# EasyEDA Pro project 手势小车.epro

# Schematic Schematic1
Assembly Variant: Basic; Board Name: Board1; Create Date: 2026-04-14; Page Name: P1; Project Name: TB-112-基于双模无线通信的智能小车运动控制系统设计; Schematic Name: Schematic1; Update Date: 2026-04-14; Company: 嘉立创EDA; Page Size: A4; Version: V1.0
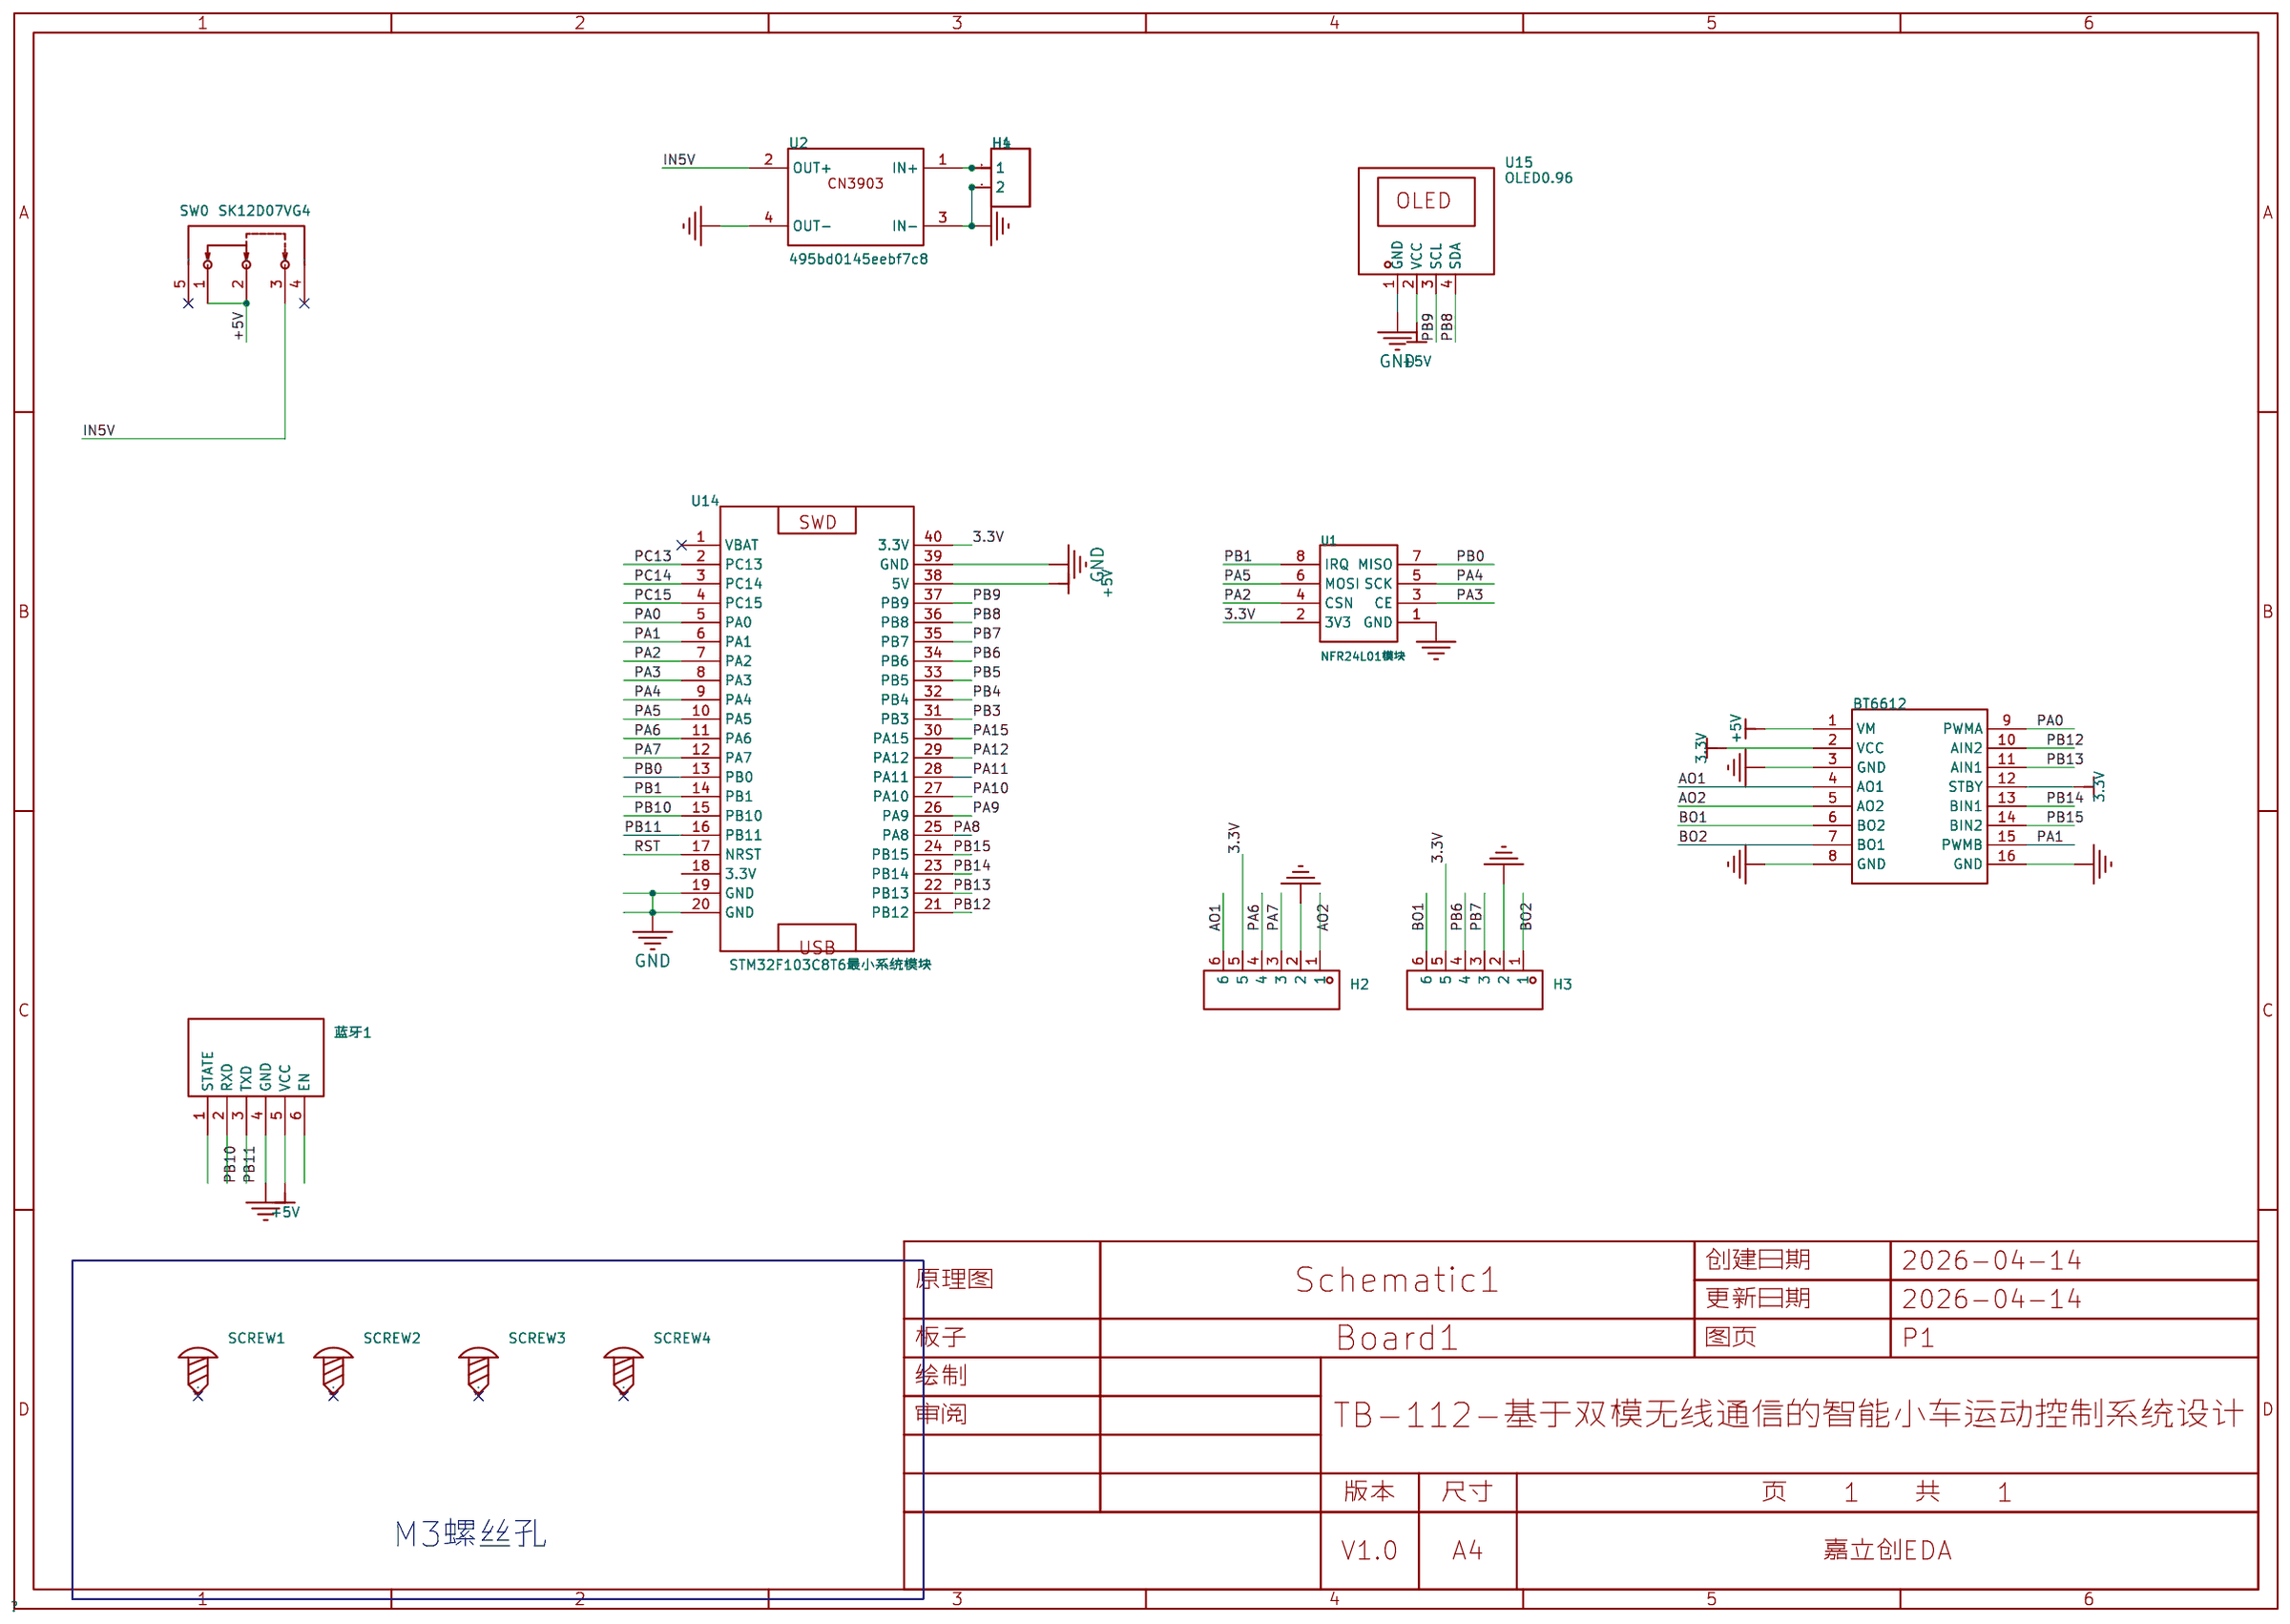
[diagram p0: schematic sheet]

## Parts
BT6612  -  [TB6612模块]
H1  -  [HDR-TH_2P-P2.54-V-F]
H2  -  [HDR-TH_6P-P2.54-V-F]
H3  -  [HDR-TH_6P-P2.54-V-F]
H4  -  [HDR-TH_2P-P2.54-V-F]
SCREW1  -  [M3螺丝]
SCREW2  -  [M3螺丝]
SCREW3  -  [M3螺丝]
SCREW4  -  [M3螺丝]
SW0  SK12D07VG4  [SW-TH_SK12D07VG4]
U1  NFR24L01模块  [NRF24L01模块]
U2  495bd0145eebf7c8  [PWRM_SMD_AJ38_L18_W13]
U14  STM32F103C8T6最小系统模块  [STM32F103C8T6核心板]
U15  OLED0.96  [OLED0.96-4PIN]
蓝牙1  -  [蓝牙模块]

## Library data of the parts
BT6612 = tb6612模块
H1 H4 = HDR-F_2.54_1x2P: Supplier Part: C49661; Supplier Footprint: 插件
H2 H3 = HDR-F_2.54_1x6P: Supplier Part: C40877; Supplier Footprint: 插件
SCREW1-SCREW4 = M3螺丝: Supplier Footprint: 插件
SW0 = SK12D07VG4: 电路结构:单刀双掷;安装方式:-;额定电流(DC):500mA;额定电压(DC):50V;额定电流(AC):-;额定电压(AC):-;机械寿命:5千次;; LCSC Part Name: 3脚2档位 卧插 滑动开关; Supplier Part: C393937; Manufacturer: SHOU HAN(首韩); Supplier Footprint: 插件; JLCPCB Part Class: 扩展库; Datasheet: https://atta.szlcsc.com/upload/public/pdf/source/20190521/C393937_939FE26E571CC67D2D532E953108A1B0.pdf; Supplier: LCSC; Circuit: 单刀双掷; Actuator Style: 矩形柱状; Pin Style: PC引脚; Switch Height: 8.8mm; Current Rating (DC): 500mA; Voltage Rating (DC): 50V; Mechanical Life: 5千次; ID: $1I1933
U1 = NFR24L01模块
U2 = PWRM_AJ38_Buck_3A: 4.5V-30V输入，3A，迷你降压模块
U14 = STM32F103C8T6核心板: tags: STM32; Supplier Part: C8734; Manufacturer: 无; image: http://image.lceda.cn/szlcsc/C8734.jpg; _: 3; JLCPCB Part Class: 扩展库
U15 = OLED0.96
蓝牙1 = 蓝牙模块: HC-05; Manufacturer: 无; Manufacturer Part: 无; Supplier Part: 无; Supplier: Taobao; link: 无

## Nets
3.3V: BT6612.2(VCC) BT6612.12(STBY) H2.5 H3.5 U1.2(3V3) U14.40(3.3V)
+5V: BT6612.1(VM) SW0.1 SW0.2 U14.38(5V) U15.2(VCC) 蓝牙1.5(VCC)
+12V: H1.1 H4.1 U2.1(IN+)
GND: BT6612.3(GND) BT6612.8(GND) BT6612.16(GND) H1.2 H2.2 H3.2 H4.2 U1.1(GND) U2.3(IN-) U2.4(OUT-) U14.19(GND) U14.20(GND) U14.39(GND) U15.1(GND) 蓝牙1.4(GND)
AO1: BT6612.4(AO1) H2.6
AO2: BT6612.5(AO2) H2.1
BO1: BT6612.6(BO2) H3.6
BO2: BT6612.7(BO1) H3.1
IN5V: SW0.3 U2.2(OUT+)
PA0: BT6612.9(PWMA) U14.5(PA0)
PA1: BT6612.15(PWMB) U14.6(PA1)
PA2: U1.4(CSN) U14.7(PA2)
PA3: U1.3(CE) U14.8(PA3)
PA4: U1.5(SCK) U14.9(PA4)
PA5: U1.6(MOSI) U14.10(PA5)
PA6: H2.4 U14.11(PA6)
PA7: H2.3 U14.12(PA7)
PA8: U14.25(PA8)
PA9: U14.26(PA9)
PA10: U14.27(PA10)
PA11: U14.28(PA11)
PA12: U14.29(PA12)
PA15: U14.30(PA15)
PB0: U1.7(MISO) U14.13(PB0)
PB1: U1.8(IRQ) U14.14(PB1)
PB3: U14.31(PB3)
PB4: U14.32(PB4)
PB5: U14.33(PB5)
PB6: H3.4 U14.34(PB6)
PB7: H3.3 U14.35(PB7)
PB8: U14.36(PB8) U15.4(SDA)
PB9: U14.37(PB9) U15.3(SCL)
PB10: U14.15(PB10) 蓝牙1.2(RXD)
PB11: U14.16(PB11) 蓝牙1.3(TXD)
PB12: BT6612.10(AIN2) U14.21(PB12)
PB13: BT6612.11(AIN1) U14.22(PB13)
PB14: BT6612.13(BIN1) U14.23(PB14)
PB15: BT6612.14(BIN2) U14.24(PB15)
PC13: U14.2(PC13)
PC14: U14.3(PC14)
PC15: U14.4(PC15)
RST: U14.17(NRST)

Not connected (* = marked no-connect by the designer): SCREW1 1*; SCREW2 1*; SCREW3 1*; SCREW4 1*; SW0 4* 5*; U14 1(VBAT)* 18(3.3V); 蓝牙1 1(STATE) 6(EN)

## Notes on the sheet
- M3螺丝孔

# Schematic Schematic2
Assembly Variant: Basic; Board Name: Board2; Create Date: 2026-04-14; Page Name: P1; Project Name: TB-112-基于双模无线通信的智能小车运动控制系统设计; Schematic Name: Schematic2; Update Date: 2026-04-14; Company: 嘉立创EDA; Page Size: A4; Version: V1.0
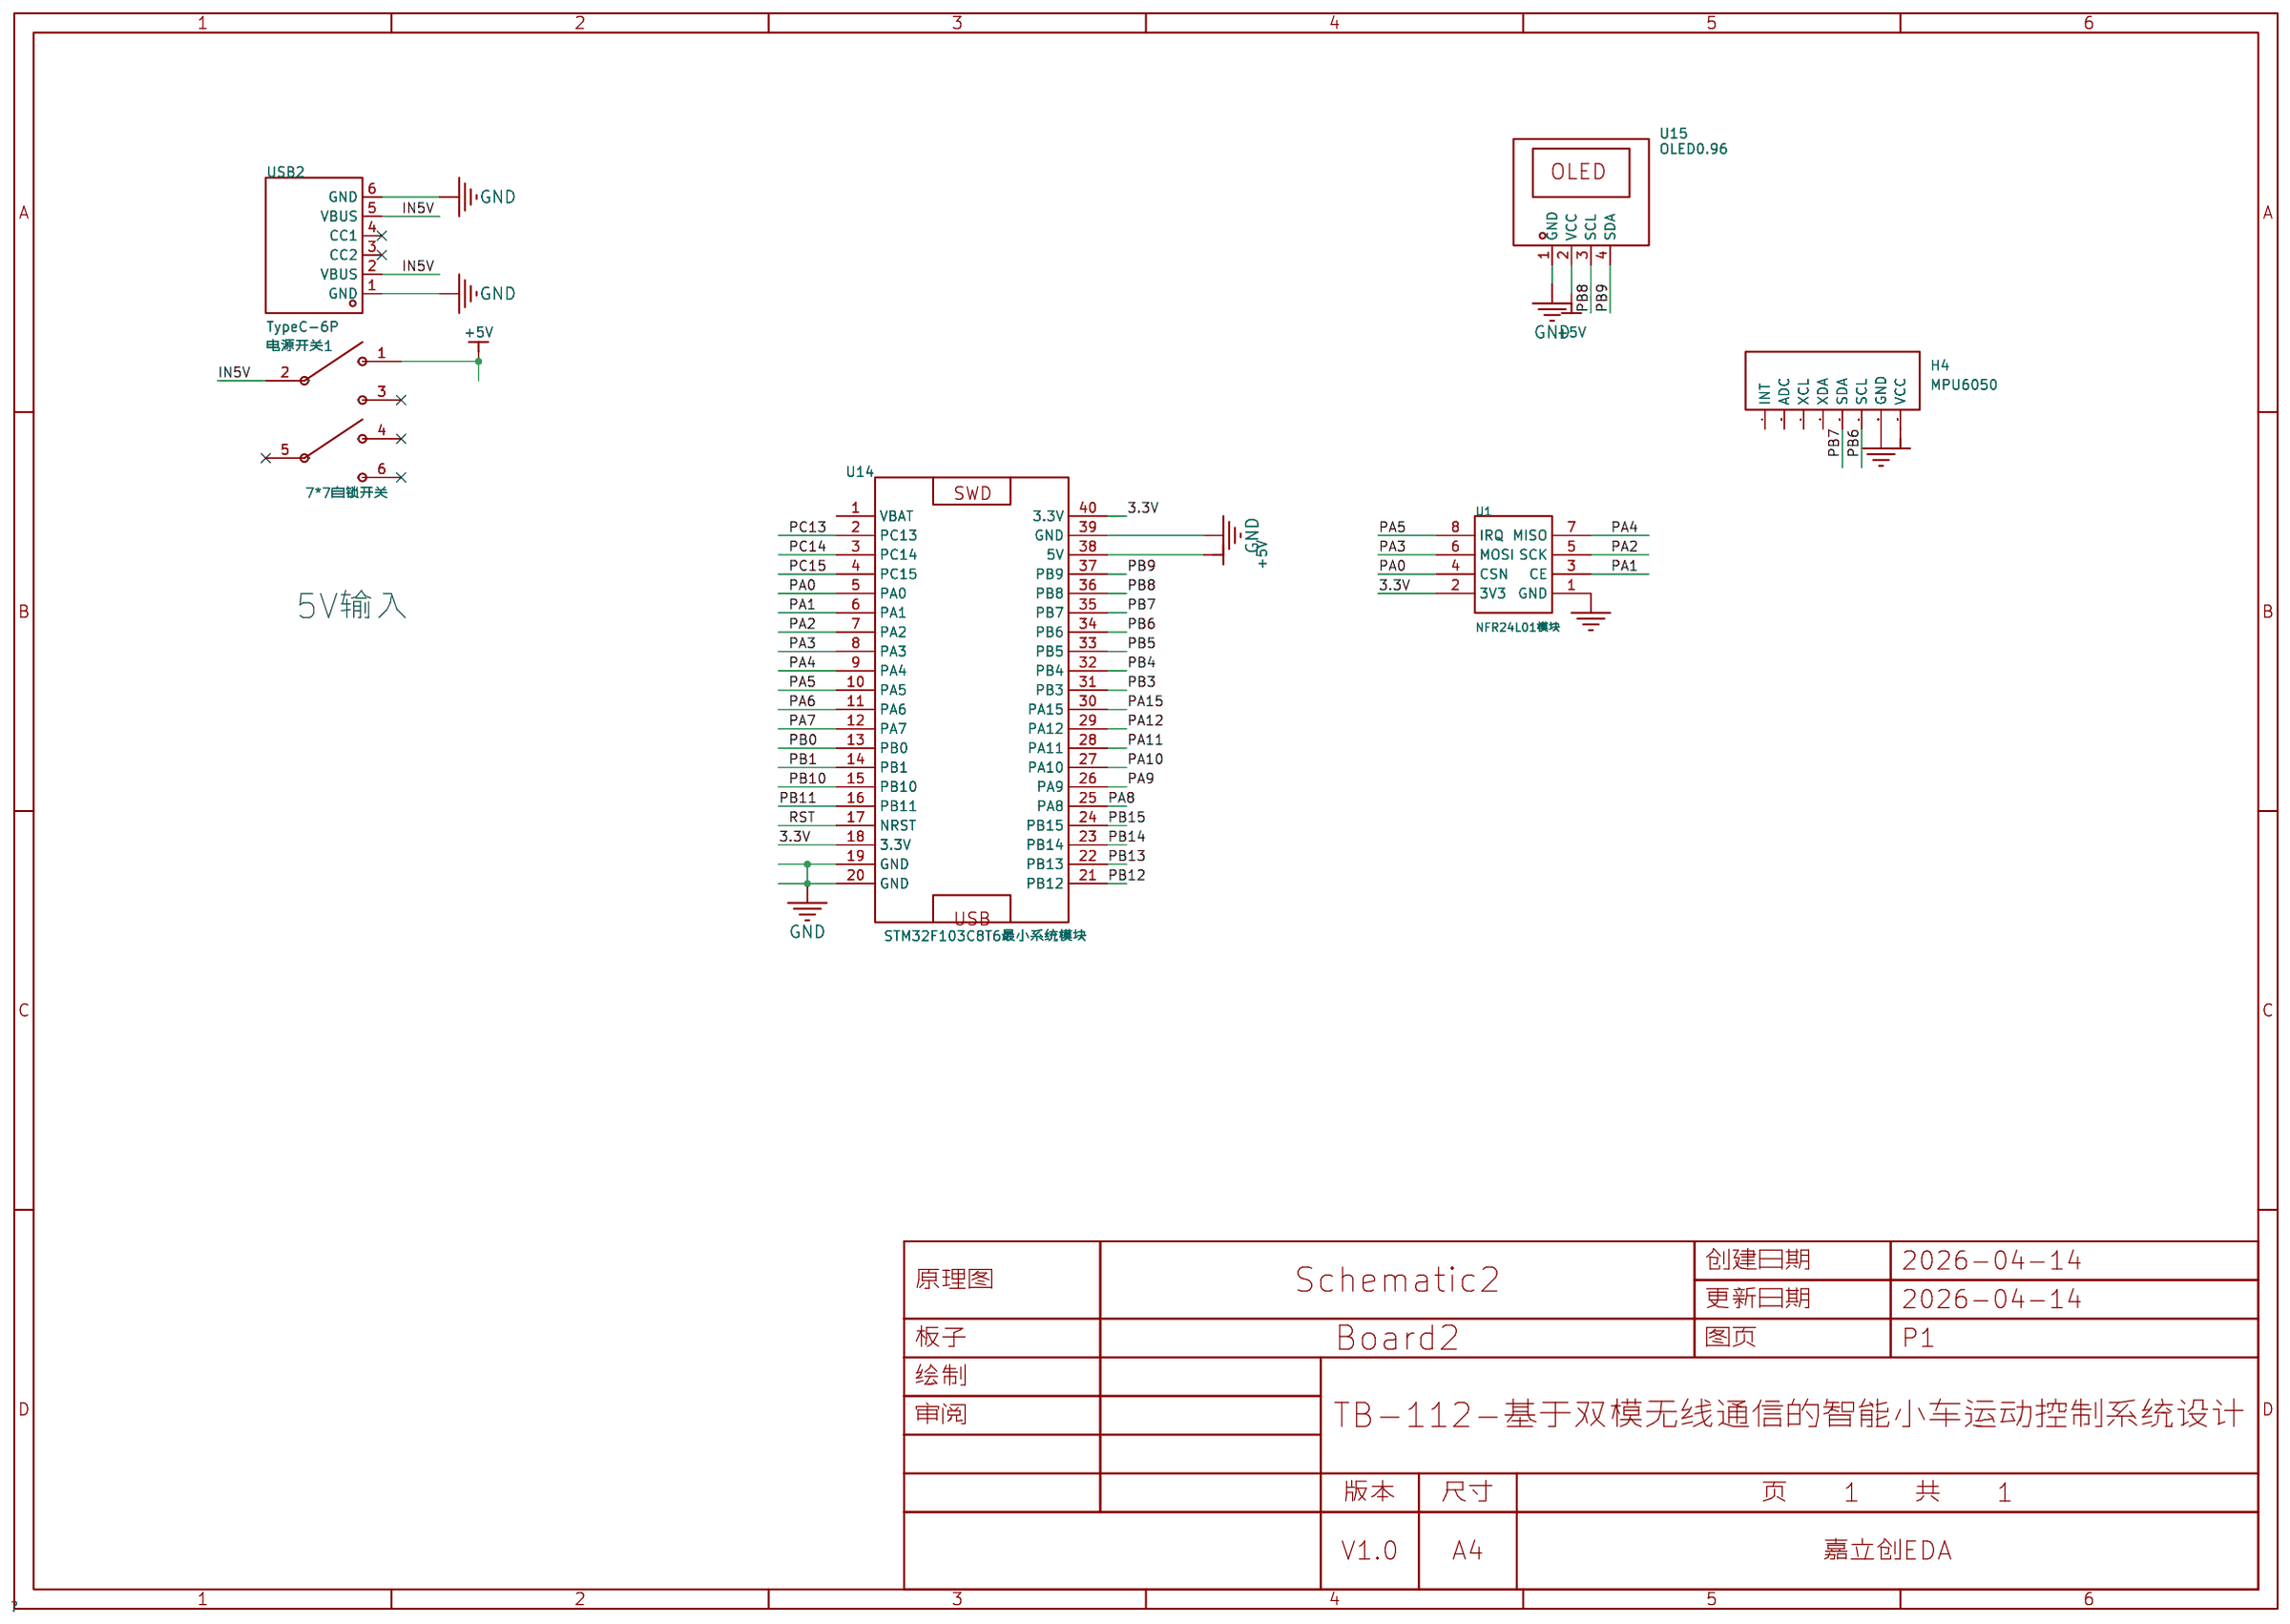
[diagram p1: schematic sheet]

## Parts
H4  MPU6050  [MPU6050模块]
U1  NFR24L01模块  [NRF24L01模块]
U14  STM32F103C8T6最小系统模块  [STM32F103C8T6核心板]
U15  OLED0.96  [OLED0.96-4PIN]
USB2  TypeC-6P  [TYPEC-6P]
电源开关1  7*7自锁开关  [7*7自锁开关]

## Library data of the parts
H4 = MPU6050模块: _: 3
U1 = NFR24L01模块
U14 = STM32F103C8T6核心板: tags: STM32; Supplier Part: C8734; Manufacturer: 无; image: http://image.lceda.cn/szlcsc/C8734.jpg; _: 3; JLCPCB Part Class: 扩展库
U15 = OLED0.96
USB2 = TYPEC-6P COPY: Supplier: 淘宝; Supplier Part: C720624; Manufacturer: XUNPU(讯普); JLCPCB Part Class: 扩展库; link: 8.0 hi:/哈JXGsXK5mtSC信  贴片USB-3.1插座 Type-C母座 6P简易型 4固定插脚 大电流快冲专用
电源开关1 = 7*7自锁开关: Supplier Part: 6; Supplier: 淘宝; link: https://item.taobao.com/item.htm?spm=a1z09.2.0.0.5y5hcl&id=22614135538&_u=21p4iun08d4e; _: 3

## Nets
3.3V: U1.2(3V3) U14.18(3.3V) U14.40(3.3V)
+5V: H4.VCC U14.38(5V) U15.2(VCC) 电源开关1.1(3)
GND: H4.GND U1.1(GND) U14.19(GND) U14.20(GND) U14.39(GND) U15.1(GND) USB2.1(GND) USB2.6(GND)
IN5V: USB2.2(VBUS) USB2.5(VBUS) 电源开关1.2(1)
PA0: U1.4(CSN) U14.5(PA0)
PA1: U1.3(CE) U14.6(PA1)
PA2: U1.5(SCK) U14.7(PA2)
PA3: U1.6(MOSI) U14.8(PA3)
PA4: U1.7(MISO) U14.9(PA4)
PA5: U1.8(IRQ) U14.10(PA5)
PA6: U14.11(PA6)
PA7: U14.12(PA7)
PA8: U14.25(PA8)
PA9: U14.26(PA9)
PA10: U14.27(PA10)
PA11: U14.28(PA11)
PA12: U14.29(PA12)
PA15: U14.30(PA15)
PB0: U14.13(PB0)
PB1: U14.14(PB1)
PB3: U14.31(PB3)
PB4: U14.32(PB4)
PB5: U14.33(PB5)
PB6: H4.SCL U14.34(PB6)
PB7: H4.SDA U14.35(PB7)
PB8: U14.36(PB8) U15.3(SCL)
PB9: U14.37(PB9) U15.4(SDA)
PB10: U14.15(PB10)
PB11: U14.16(PB11)
PB12: U14.21(PB12)
PB13: U14.22(PB13)
PB14: U14.23(PB14)
PB15: U14.24(PB15)
PC13: U14.2(PC13)
PC14: U14.3(PC14)
PC15: U14.4(PC15)
RST: U14.17(NRST)

Not connected (* = marked no-connect by the designer): H4 ADC INT XCL XDA; U14 1(VBAT); USB2 3(CC2)* 4(CC1)*; 电源开关1 3(4)* 4(5)* 5(2)* 6*

## Notes on the sheet
- 5V输入

# Board PCB1
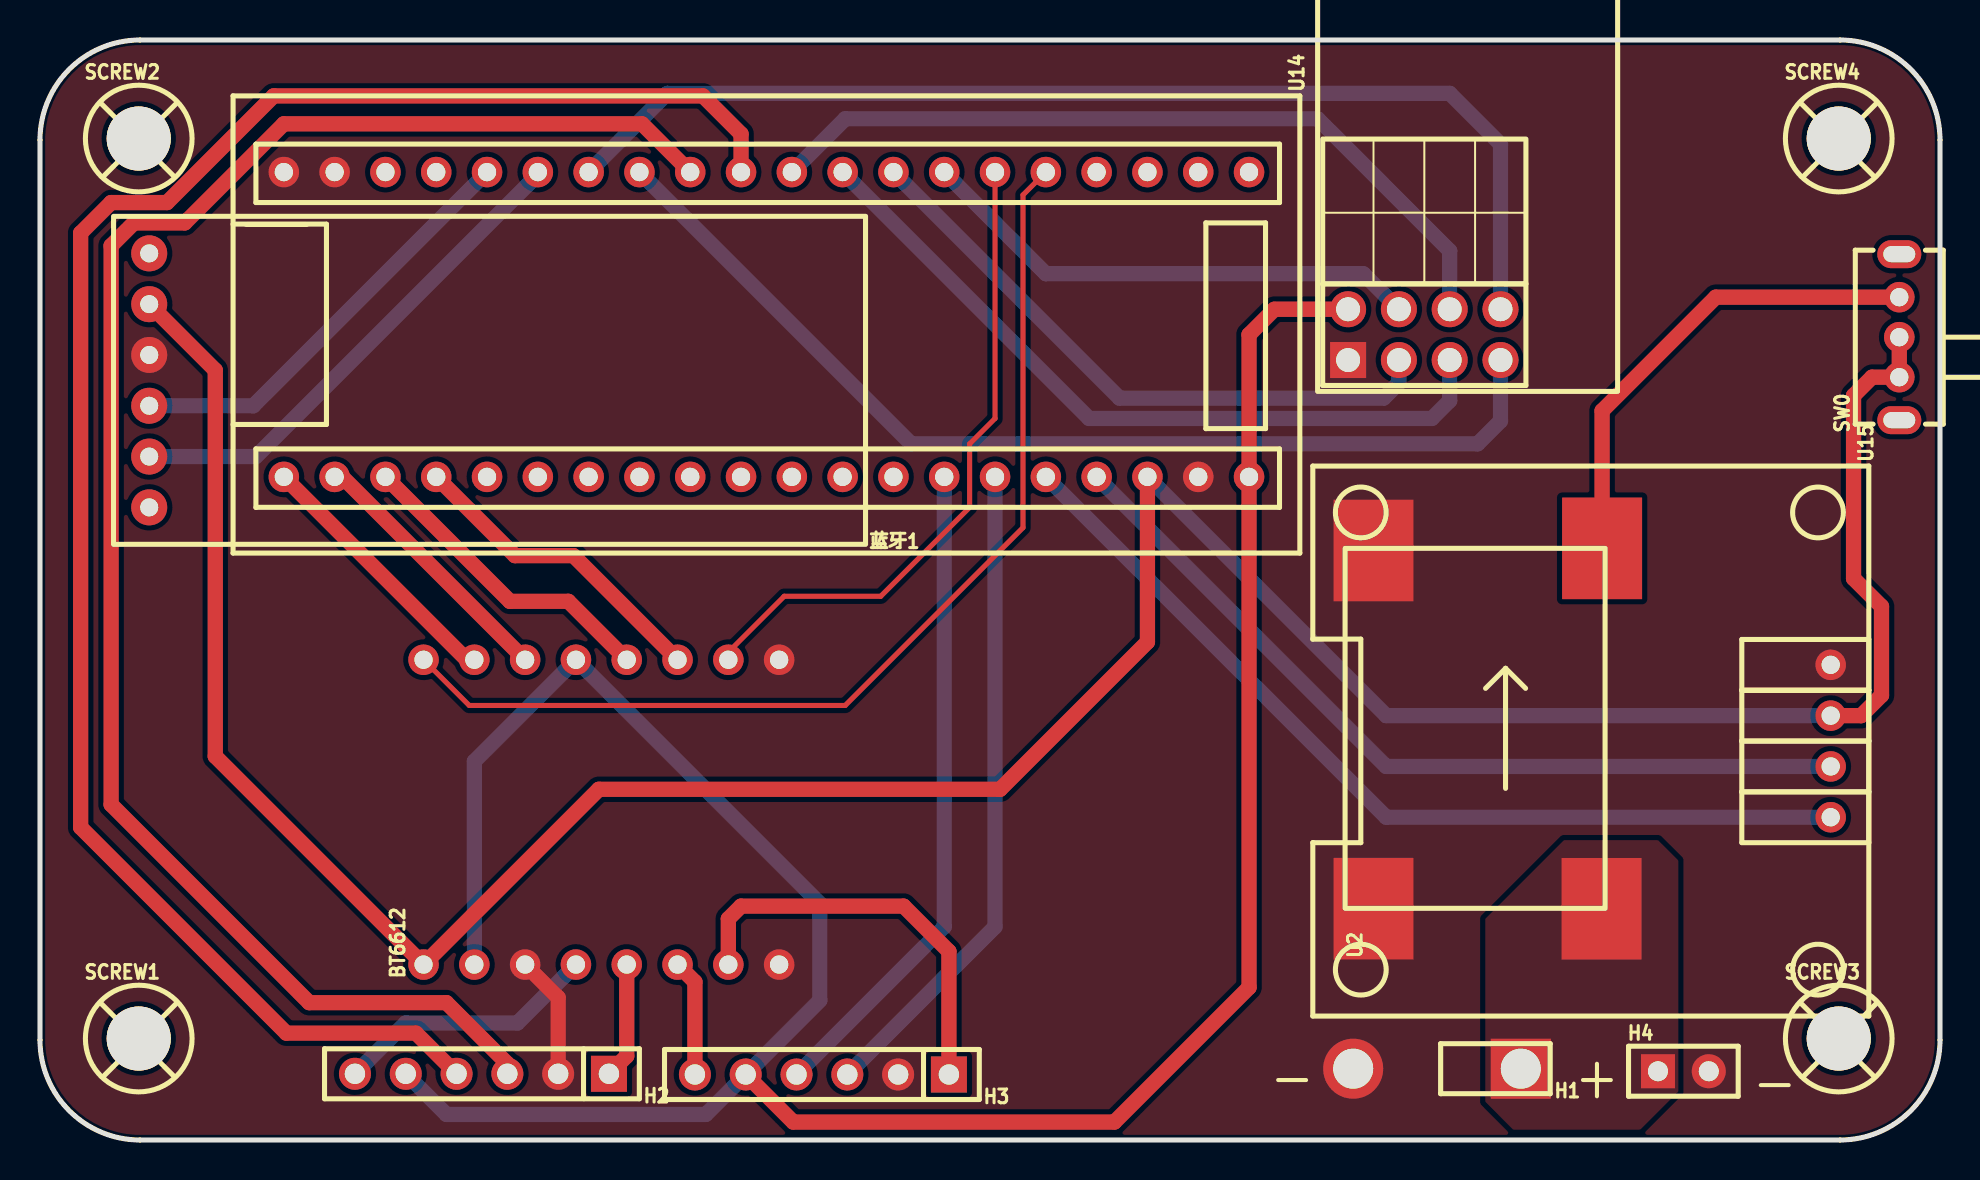
[diagram p2: board, top side]
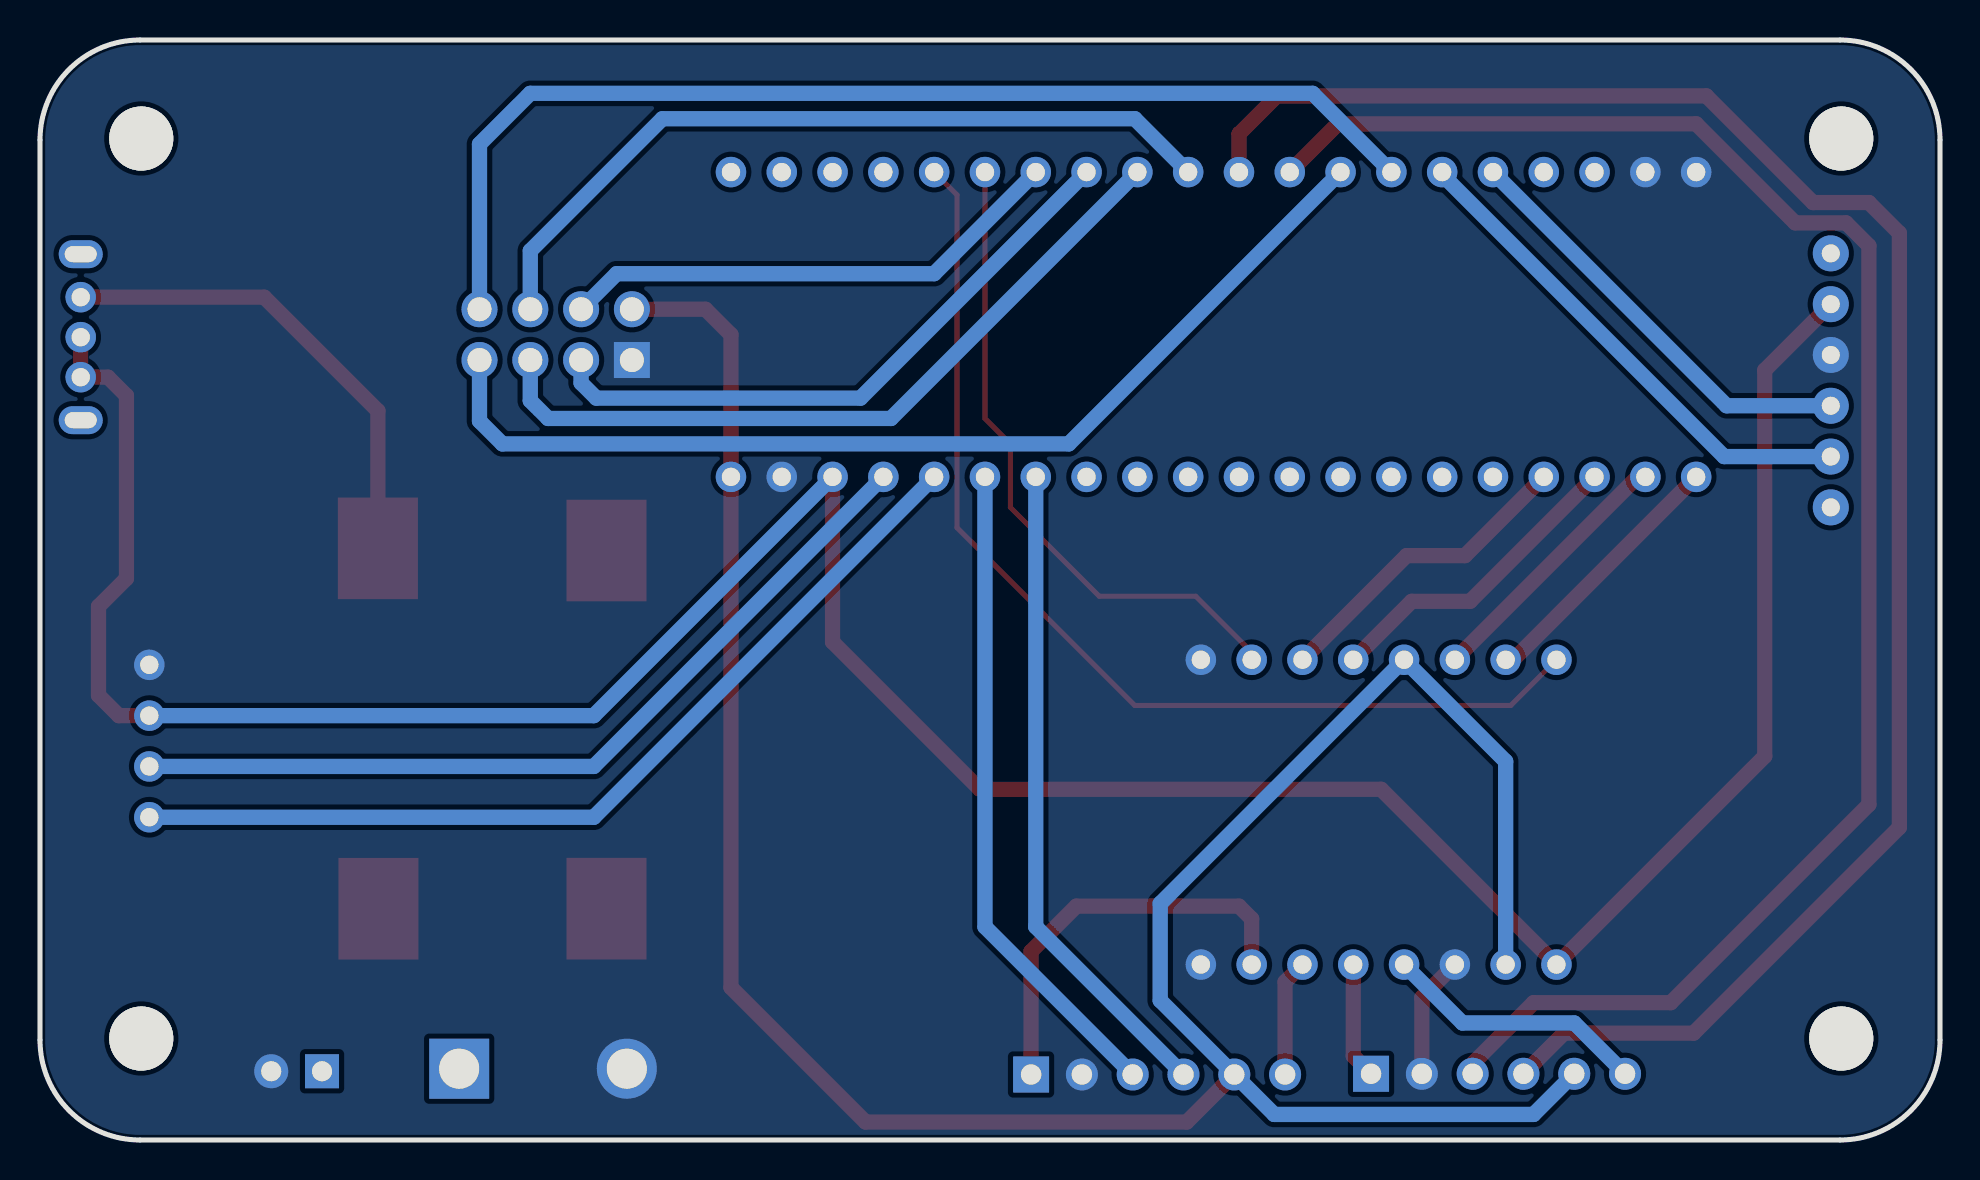
[diagram p3: board, bottom side, seen from below]

Outline 95 x 55 mm; copper layers: Top Layer, Bottom Layer. Coordinates in mm from the lower left corner of the outline.
Outline path: 0,50 0,5 arc(1.46,1.46) 5,0 90,0 arc(93.54,1.46) 95,5 95,50 arc(93.54,53.54) 90,55 5,55 arc(1.46,53.54) 0,50
Stack: Top Layer 0.035mm / Dielectric1 1.51mm FR4 er 4.5 / Bottom Layer 0.035mm

## Design rules (mm)
spacing copperThickness1oz (default): track to track 0.102, other pairs 0.152 to 0.3
spacing copperThickness2oz: track to track 0.203, other pairs 0.152 to 0.3
track width copperThickness1oz (default): min 0.127, default 0.762, max 2.54
track width copperThickness2oz: min 0.203, default 0.254, max 2.54
differential pair differentialPair (default): width min 0.127, default 0.254, max 2.54; gap min 0.152, default 0.152
net GND uses copperRegion
net +12V uses copperRegion

## Placement (name value [footprint] x y rotation side)
BT6612  -  [TB6612模块]  24.13 11.57 90 top
H1  -  [HDR-TH_2P-P2.54-V-F]  72.77 3.57 180 top
H2  -  [HDR-TH_6P-P2.54-V-F]  22.1 3.31 180 top
H3  -  [HDR-TH_6P-P2.54-V-F]  39.1 3.28 180 top
H4  -  [HDR-TH_2P-P2.54-V-F#2]  82.17 3.44 0 top
SCREW1  -  [M3螺丝]  5 5.01 0 top
SCREW2  -  [M3螺丝]  5 50.01 0 top
SCREW3  -  [M3螺丝]  90 5.01 0 top
SCREW4  -  [M3螺丝]  90 50.01 0 top
SW0  SK12D07VG4  [SW-TH_SK12D07VG4]  92.96 40.14 90 top
U1  NFR24L01模块  [NRF24L01模块]  69.22 40.27 0 top
U2  495bd0145eebf7c8  [PWRM_SMD_AJ38_L18_W13]  73.28 20.58 90 top
U14  STM32F103C8T6最小系统模块  [STM32F103C8T6核心板]  36.32 40.78 270 top
U15  OLED0.96  [OLED0.96-4PIN]  90.17 19.95 270 top
蓝牙1  -  [蓝牙模块]  23.5 38.36 180 top

## Footprints (pads in the part's own frame, mm; a bottom-side part is the same pattern mirrored in y, then rotated)
HDR-TH_2P-P2.54-V-F
  rect 3x3 hole 2: 1(-1.27,0)
  round 3 hole 2: 2(7.112,0)
HDR-TH_2P-P2.54-V-F#2
  rect 1.7x1.7 hole 1: 1(-1.27,0)
  round 1.7 hole 1: 2(1.27,0)
HDR-TH_6P-P2.54-V-F
  rect 1.8x1.8 hole 1.02: 1(-6.35,0)
  round 1.6 hole 1.02: 2(-3.81,0) 3(-1.27,0) 4(1.27,0) 5(3.81,0) 6(6.35,0)
M3螺丝
  round 3.2 hole 3.2: 1(-0.064,0.064)
NRF24L01模块
  rect 1.8x1.8 hole 1.2: 1(-3.81,-1.27)
  round 1.8 hole 1.2: 2(-3.81,1.27) 3(-1.27,-1.27) 4(-1.27,1.27) 5(1.27,-1.27) 6(1.27,1.27) 7(3.81,-1.27) 8(3.81,1.27)
OLED0.96-4PIN
  round 1.524 hole 0.914: 1(-3.81,-0.635) 2(-1.27,-0.635) 3(1.27,-0.635) 4(3.81,-0.635)
PWRM_SMD_AJ38_L18_W13
  rect 5.08x4 smd: 1(-9.02,-4.801) 2(8.999,-4.826) 3(-9.017,6.604) 4(8.89,6.604)
STM32F103C8T6核心板
  round 1.524 hole 0.914: 1(-7.62,24.13) 2(-7.62,21.59) 3(-7.62,19.05) 4(-7.62,16.51) 5(-7.62,13.97) 6(-7.62,11.43) 7(-7.62,8.89) 8(-7.62,6.35) 9(-7.62,3.81) 10(-7.62,1.27) 11(-7.62,-1.27) 12(-7.62,-3.81) 13(-7.62,-6.35) 14(-7.62,-8.89) 15(-7.62,-11.43) 16(-7.62,-13.97) 17(-7.62,-16.51) 18(-7.62,-19.05) 19(-7.62,-21.59) 20(-7.62,-24.13) 21(7.62,-24.13) 22(7.62,-21.59) 23(7.62,-19.05) 24(7.62,-16.51) 25(7.62,-13.97) 26(7.62,-11.43) 27(7.62,-8.89) 28(7.62,-6.35) 29(7.62,-3.81) 30(7.62,-1.27) 31(7.62,1.27) 32(7.62,3.81) 33(7.62,6.35) 34(7.62,8.89) 35(7.62,11.43) 36(7.62,13.97) 37(7.62,16.51) 38(7.62,19.05) 39(7.62,21.59) 40(7.62,24.13)
SW-TH_SK12D07VG4
  round 1.524 hole 0.914: 1(-2,0) 2(0,0) 3(2,0)
  oval 1.4x2.2 hole 0.8x1.6: 4(4.15,0) 5(-4.15,0)
TB6612模块
  round 1.524 hole 0.914: 1(-2.794,4.953) 2(-2.794,2.413) 3(-2.794,-0.127) 4(-2.794,-2.667) 5(-2.794,-5.207) 6(-2.794,-7.747) 7(-2.794,-10.287) 8(-2.794,-12.827) 9(12.446,4.953) 10(12.446,2.413) 11(12.446,-0.127) 12(12.446,-2.667) 13(12.446,-5.207) 14(12.446,-7.747) 15(12.446,-10.287) 16(12.446,-12.827)
蓝牙模块
  round 1.8 hole 0.9: 1(18.034,6.731) 2(18.034,4.191) 3(18.034,1.651) 4(18.034,-0.889) 5(18.034,-3.429) 6(18.034,-5.969)

## Nets
As in the schematic.

Pads without a net: SCREW1 1; SCREW2 1; SCREW3 1; SCREW4 1; SW0 4 5; U14 1 18

## Routing (per net, layer and track width the routed paths; a pad name or vN(x,y) marks a point on that pad's centre or on a via; arc(x,y) is an arc through that point)
3.3V: length 130.4
  Top Layer w0.762: H3.5 37.66,0.9 53.72,0.9 60.45,7.63 U14.40 60.45,40.27 61.72,41.54 U1.2
  Bottom Layer w0.762: BT6612.2 21.72,18.93 BT6612.12 38.99,11.82 38.99,6.98 H3.5 33.29,1.28 20.32,1.28 H2.5
+5V: length 152.1
  Top Layer w0.762: U15.2 91.06,21.22 92.07,22.23 92.07,26.68 90.68,28.08 90.68,37.22 91.6,38.14 SW0.1 SW0.2 ; U14.38 55.37,24.9 48.01,17.54 27.94,17.54 BT6612.1 8.76,19.19 8.76,38.49 5.46,41.79
  Bottom Layer w0.762: U15.2 67.31,21.22 U14.38
GND: length 6.1
  Top Layer w0.762: BT6612.3 25.91,7.12 H2.2
AO1: length 13.3
  Bottom Layer w0.762: BT6612.4 23.88,5.85 18.29,5.85 H2.6
AO2: length 5.8
  Top Layer w0.762: H2.1 29.34,4.2 BT6612.5
BO1: length 5.9
  Top Layer w0.762: H3.6 32.75,7.9 BT6612.6
BO2: length 20.7
  Top Layer w0.762: H3.1 45.45,9.43 43.18,11.69 35.05,11.69 34.42,11.06 BT6612.7
IN5V: length 24.1
  Top Layer w0.762: SW0.3 83.79,42.14 78.1,36.46 U2.2
PA0: length 52.9
  Top Layer w0.254: U14.5 49.15,47.25 49.15,30.62 40.26,21.73 21.46,21.73 BT6612.9
PA1: length 32.7
  Top Layer w0.254: BT6612.15 34.42,24.39 37.21,27.19 42.04,27.19 46.48,31.63 46.48,34.81 47.75,36.08 U14.6
PA2: length 25.6
  Bottom Layer w0.762: U14.7 50.29,43.32 66.17,43.32 U1.4
PA3: length 31.4
  Bottom Layer w0.762: U1.3 67.94,37.86 67.18,37.09 53.97,37.09 U14.8
PA4: length 37.9
  Bottom Layer w0.762: U14.9 52.45,36.08 69.6,36.08 70.49,36.97 U1.5
PA5: length 39.7
  Bottom Layer w0.762: U1.6 70.49,44.46 63.88,51.06 40.26,51.06 U14.10
PA6: length 92.2
  Top Layer w0.762: H2.4 18.8,5.34 12.32,5.34 2.03,15.63 2.03,45.35 3.56,46.87 6.35,46.87 11.68,52.21 33.15,52.21 35.05,50.3 U14.11
PA7: length 86.1
  Top Layer w0.762: U14.12 30.1,50.81 12.19,50.81 7.24,45.86 4.7,45.86 3.56,44.71 3.56,16.77 13.46,6.87 20.32,6.87 23.37,3.82 H2.3
PB0: length 52.2
  Bottom Layer w0.762: U14.13 43.56,34.81 71.88,34.81 73.03,35.95 U1.7
PB1: length 56.5
  Bottom Layer w0.762: U1.8 73.03,49.79 70.49,52.33 31.37,52.33 U14.14
PB6: length 32.9
  Bottom Layer w0.762: H3.4 45.21,10.66 U14.34
PB7: length 32.9
  Bottom Layer w0.762: U14.35 47.75,10.66 H3.3
PB8: length 46.3
  Bottom Layer w0.762: U14.36 67.31,16.14 U15.4
PB9: length 42.7
  Bottom Layer w0.762: U15.3 67.31,18.68 U14.37
PB10: length 25.4
  Bottom Layer w0.762: 5.46,34.17 10.8,34.17 24.89,48.27 U14.15
PB11: length 21.7
  Bottom Layer w0.762: 5.46,36.71 10.67,36.71 U14.16
PB12: length 13.3
  Top Layer w0.762: U14.21 21.34,24.01 BT6612.10
PB13: length 13.3
  Top Layer w0.762: U14.22 15.11,33.16 BT6612.11
PB14: length 15.9
  Top Layer w0.762: U14.23 23.5,26.93 26.42,26.93 BT6612.13
PB15: length 15.9
  Top Layer w0.762: BT6612.14 26.67,29.22 23.75,29.22 U14.24

## Copper pours and planes (outline as drawn; the poured copper is in the pictures)
+12V on Top Layer: 76.2,15 80.9,15 81.91,13.98 81.91,2.42 80.01,0.52 73.66,0.52 72.26,1.91 72.26,11.06
GND on Top Layer: -6.98,60.08 102.87,60.08 102.87,-9.01 -6.98,-9.01
GND on Bottom Layer: -3.68,63.89 105.03,63.89 105.03,-7.99 -3.68,-7.99

## Text on the board
Top Silkscreen Layer: - | +

# Board PCB2
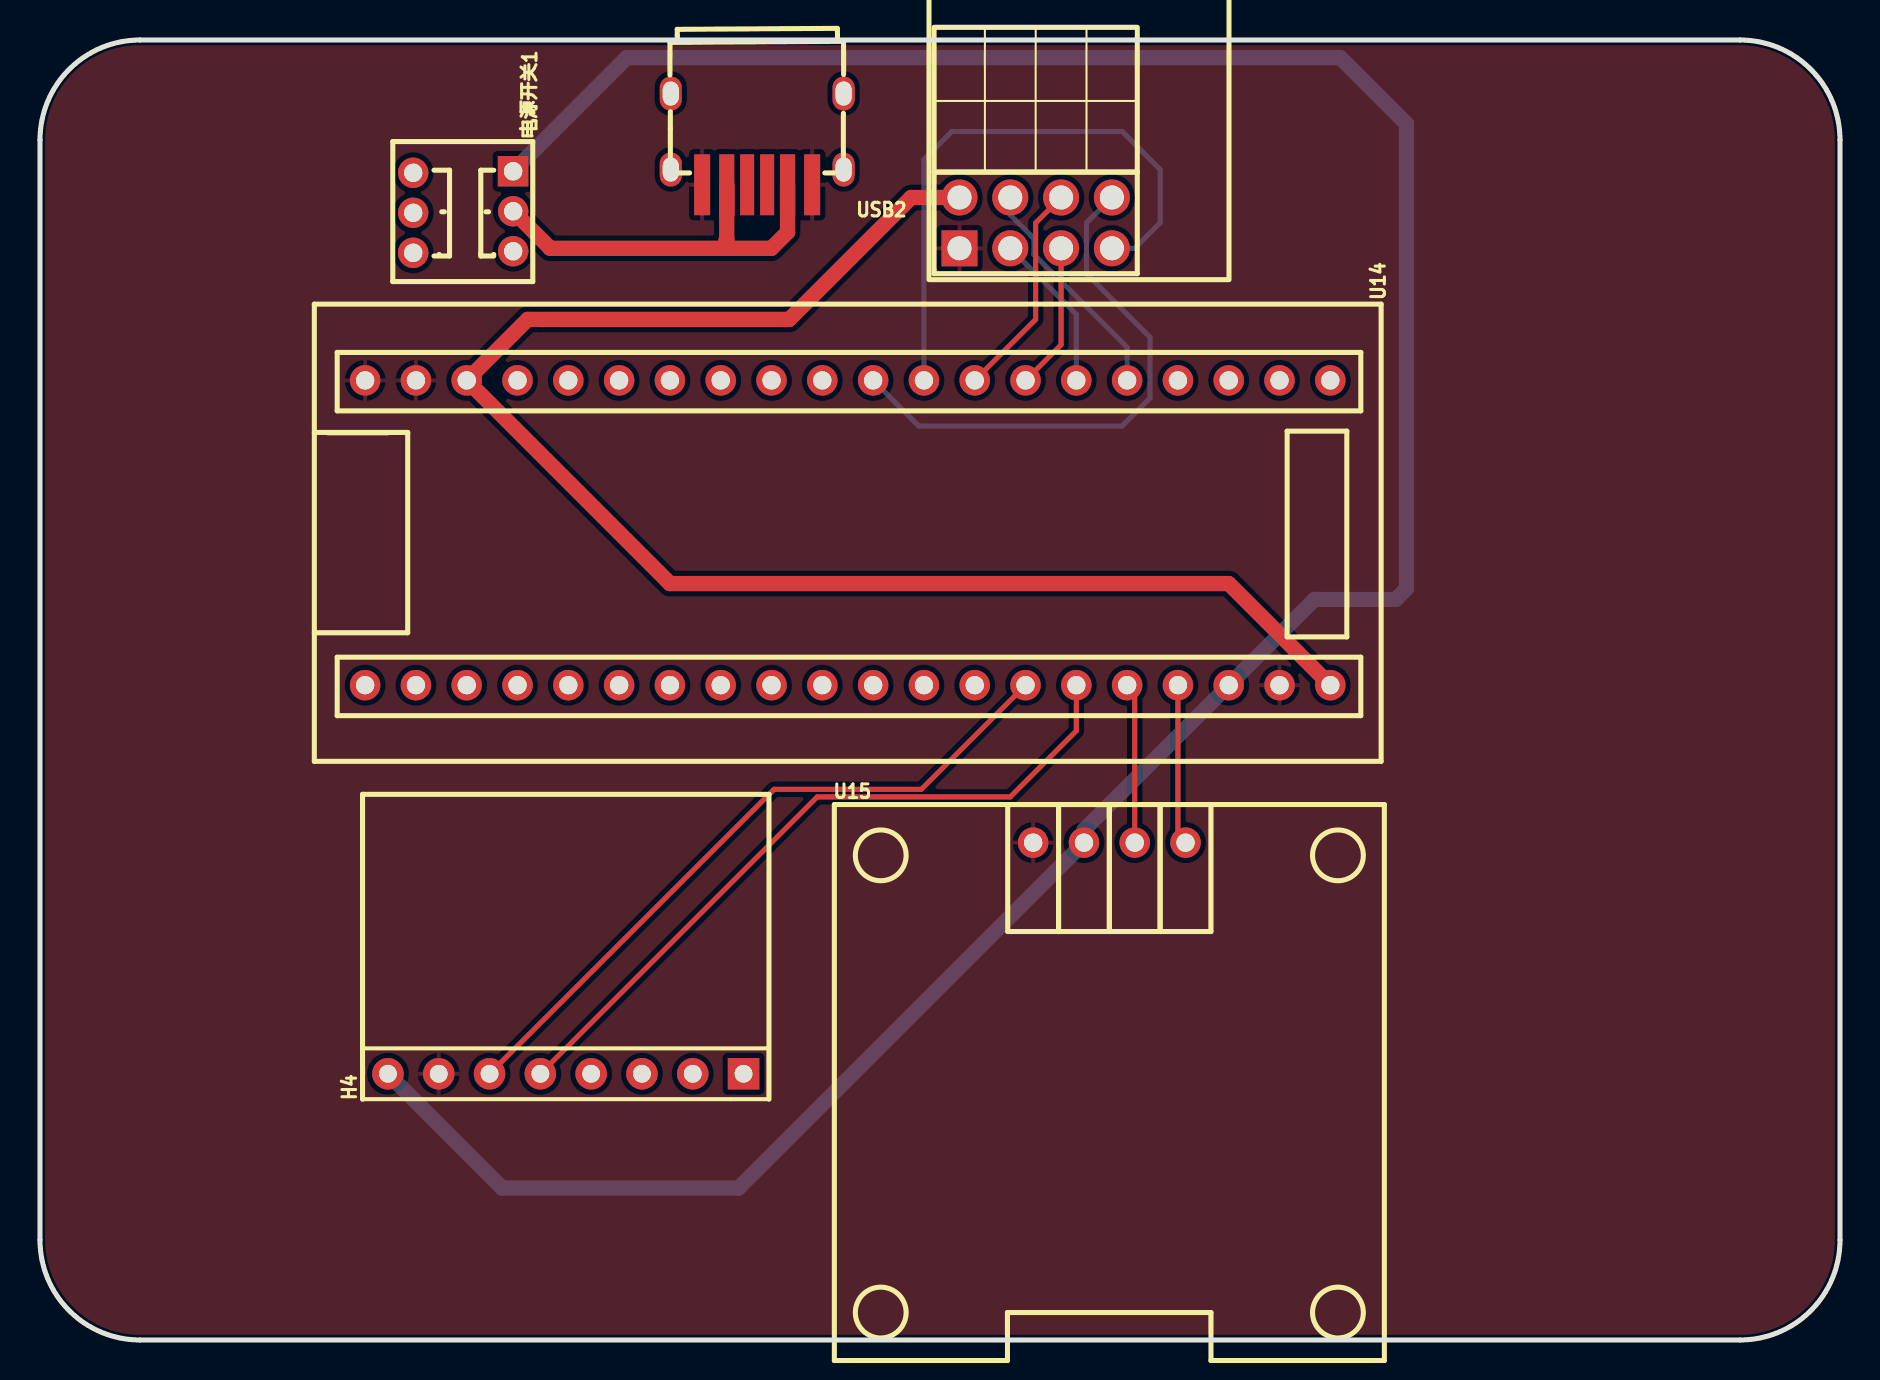
[diagram p4: board, top side]
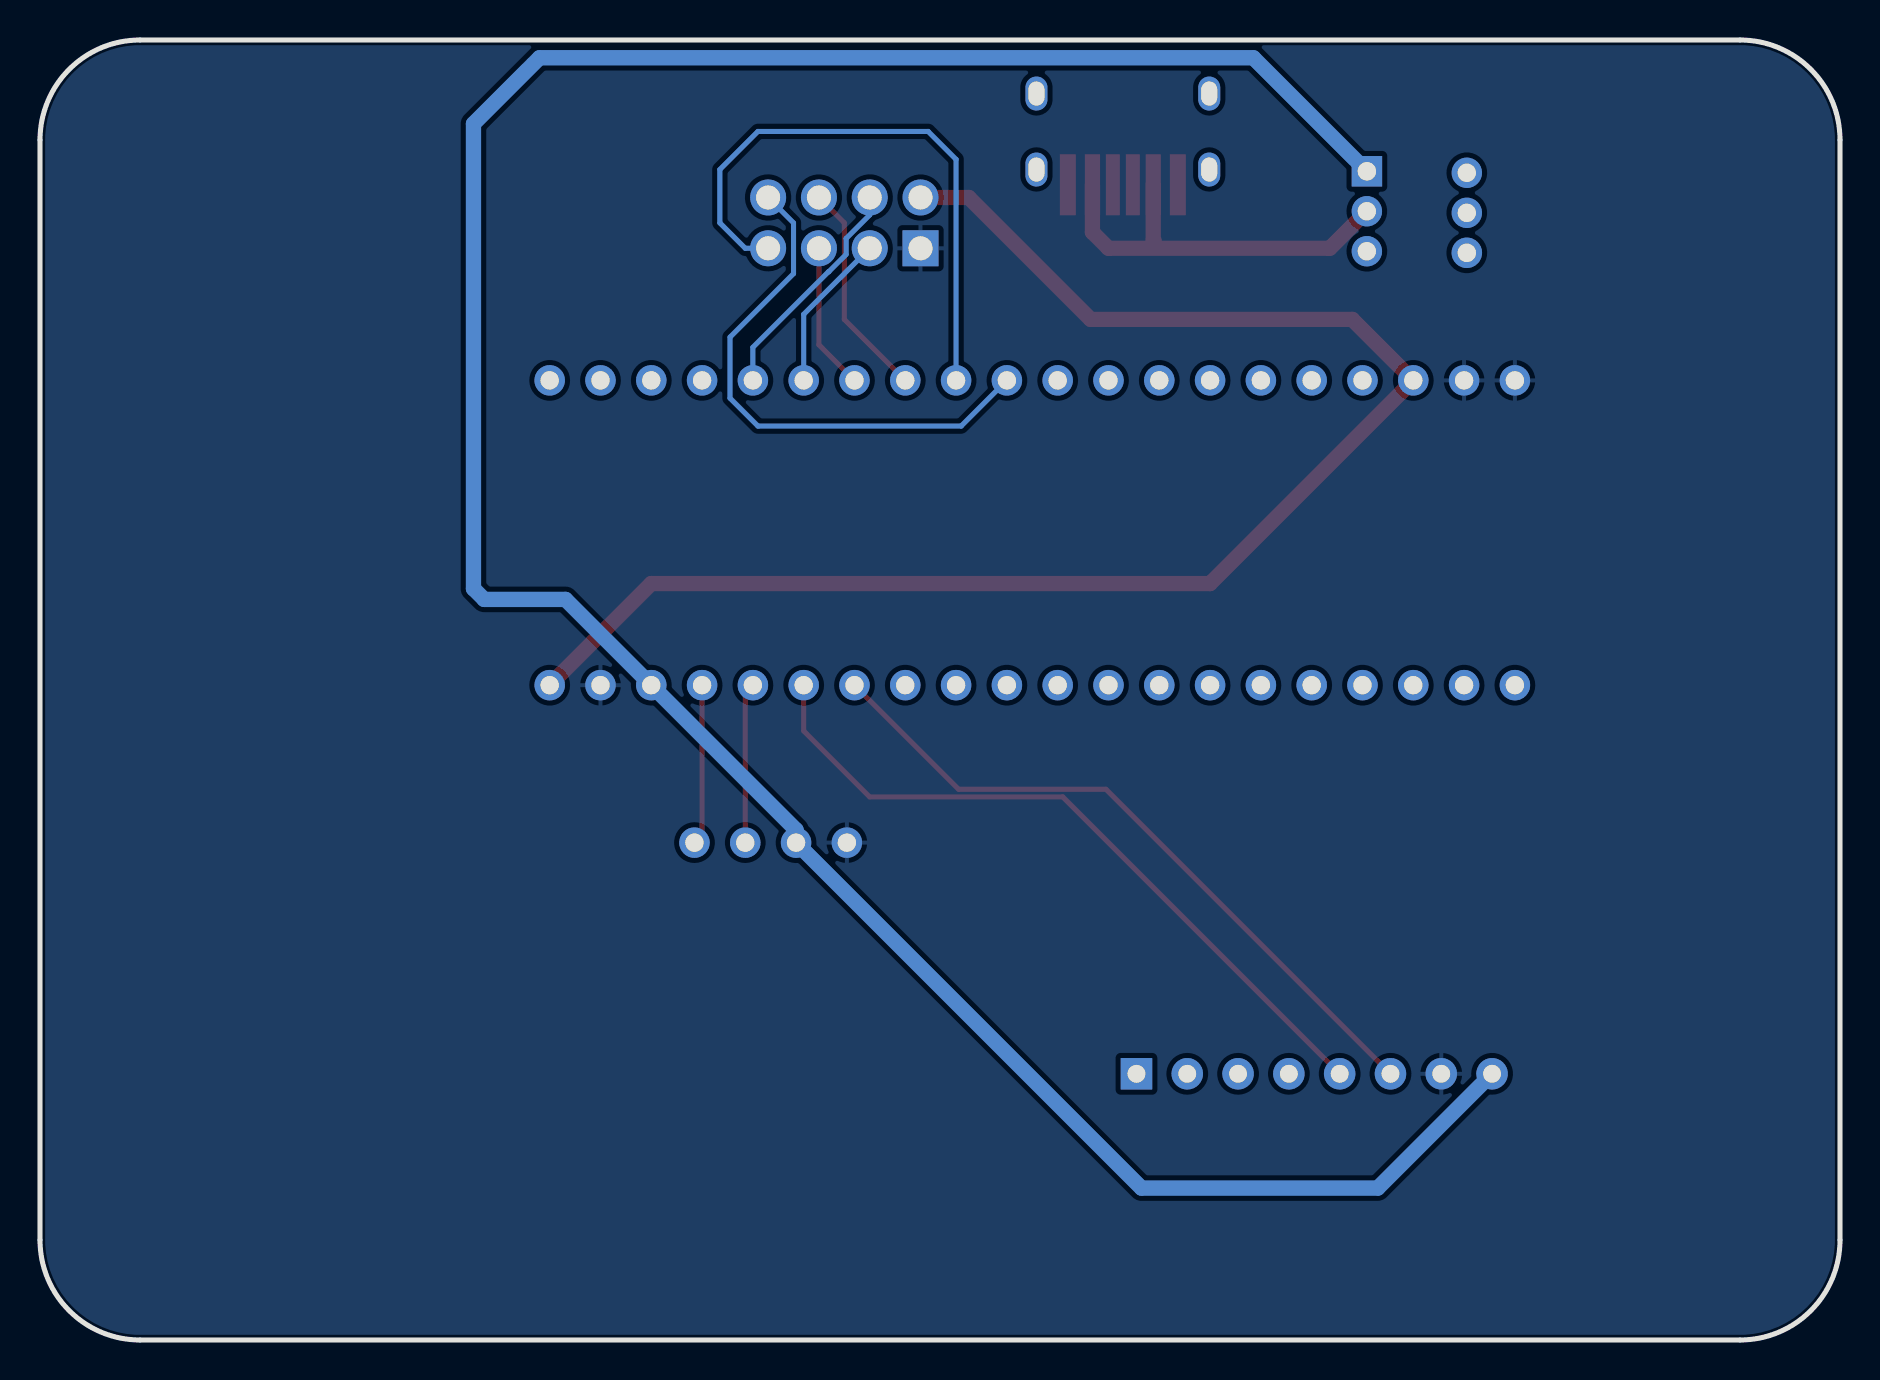
[diagram p5: board, bottom side, seen from below]

Outline 90 x 65 mm; copper layers: Top Layer, Bottom Layer. Coordinates in mm from the lower left corner of the outline.
Outline path: 0,60 0,5 arc(1.46,1.46) 5,0 85,0 arc(88.54,1.46) 90,5 90,60 arc(88.54,63.54) 85,65 5,65 arc(1.46,63.54) 0,60
Stack: Top Layer 0.035mm / Dielectric1 1.51mm FR4 er 4.5 / Bottom Layer 0.035mm

## Design rules (mm)
spacing copperThickness1oz (default): track to track 0.102, other pairs 0.152 to 0.3
spacing copperThickness2oz: track to track 0.203, other pairs 0.152 to 0.3
track width copperThickness1oz (default): min 0.127, default 0.762, max 2.54
track width copperThickness2oz: min 0.203, default 0.254, max 2.54
differential pair differentialPair (default): width min 0.127, default 0.254, max 2.54; gap min 0.152, default 0.152
net GND uses copperRegion

## Placement (name value [footprint] x y rotation side)
H4  MPU6050  [MPU6050模块]  26.29 12.04 90 top
U1  NFR24L01模块  [NRF24L01模块]  49.78 55.86 0 top
U14  STM32F103C8T6最小系统模块  [STM32F103C8T6核心板]  40.39 40.36 270 top
U15  OLED0.96  [OLED0.96-4PIN]  53.47 25.5 0 top
USB2  TypeC-6P  [TYPEC-6P]  38.61 58.52 180 top
电源开关1  -  [7*7自锁开关]  24.64 59.92 270 top

## Footprints (pads in the part's own frame, mm; a bottom-side part is the same pattern mirrored in y, then rotated)
7*7自锁开关
  rect 1.524x1.524 hole 0.919x0.914: 1(1.484,-0.983)
  round 1.52 hole 0.915x0.91: 2(3.482,-0.981) 3(5.481,-0.981) 4(1.56,-5.979) 5(3.561,-5.979)
  round 1.524 hole 0.919x0.914: 6(5.56,-5.979)
MPU6050模块
  round 1.575 hole 0.889: ADC(1.27,-6.348) GND(1.27,6.352) SCL(1.27,3.812) SDA(1.27,1.272) VCC(1.27,8.892) XCL(1.27,-3.808) XDA(1.27,-1.268)
  rect 1.575x1.575 hole 0.889: INT(1.27,-8.888)
NRF24L01模块
  rect 1.8x1.8 hole 1.2: 1(-3.81,-1.27)
  round 1.8 hole 1.2: 2(-3.81,1.27) 3(-1.27,-1.27) 4(-1.27,1.27) 5(1.27,-1.27) 6(1.27,1.27) 7(3.81,-1.27) 8(3.81,1.27)
OLED0.96-4PIN
  round 1.524 hole 0.914: 1(-3.81,-0.635) 2(-1.27,-0.635) 3(1.27,-0.635) 4(3.81,-0.635)
STM32F103C8T6核心板
  round 1.524 hole 0.914: 1(-7.62,24.13) 2(-7.62,21.59) 3(-7.62,19.05) 4(-7.62,16.51) 5(-7.62,13.97) 6(-7.62,11.43) 7(-7.62,8.89) 8(-7.62,6.35) 9(-7.62,3.81) 10(-7.62,1.27) 11(-7.62,-1.27) 12(-7.62,-3.81) 13(-7.62,-6.35) 14(-7.62,-8.89) 15(-7.62,-11.43) 16(-7.62,-13.97) 17(-7.62,-16.51) 18(-7.62,-19.05) 19(-7.62,-21.59) 20(-7.62,-24.13) 21(7.62,-24.13) 22(7.62,-21.59) 23(7.62,-19.05) 24(7.62,-16.51) 25(7.62,-13.97) 26(7.62,-11.43) 27(7.62,-8.89) 28(7.62,-6.35) 29(7.62,-3.81) 30(7.62,-1.27) 31(7.62,1.27) 32(7.62,3.81) 33(7.62,6.35) 34(7.62,8.89) 35(7.62,11.43) 36(7.62,13.97) 37(7.62,16.51) 38(7.62,19.05) 39(7.62,21.59) 40(7.62,24.13)
TYPEC-6P
  rect 0.8x3.048 smd: 1(0,0.762) 6(5.5,0.762)
  rect 0.76x3.048 smd: 2(1.23,0.762) 5(4.27,0.762)
  rect 0.7x3.048 smd: 3(2.25,0.762) 4(3.25,0.762)
  oval 1.1x1.7 hole 0.8x1.2: 7(-1.57,0) 8(7.07,0) 9(7.07,-3.8) 10(-1.57,-3.8)

## Nets
As in the schematic.

Pads without a net: H4 ADC INT XCL XDA; U14 1; USB2 3 4 7 8 9 10; 电源开关1 3 4 5 6

## Routing (per net, layer and track width the routed paths; a pad name or vN(x,y) marks a point on that pad's centre or on a via; arc(x,y) is an arc through that point)
3.3V: length 77.9
  Top Layer w0.762: U14.40 59.44,37.82 31.5,37.82 U14.18 24.38,51.03 37.47,51.03 43.56,57.13 U1.2
+5V: length 137.7
  Bottom Layer w0.762: 电源开关1.1 29.33,64.11 65.02,64.11 68.33,60.81 68.33,37.57 67.79,37.03 63.72,37.03 U14.38 52.2,25.5 U15.2 34.92,7.6 23.11,7.6 H4.VCC
IN5V: length 20
  Top Layer w0.762: 34.29,54.97 34.34,55.02 USB2.5 ; USB2.2 37.38,55.39 36.58,54.59 25.51,54.59 电源开关1.2
PA0: length 11.6
  Bottom Layer w0.254: U14.5 54.36,49.63 50.58,53.41 50.57,53.41 49.69,54.28 49.69,55.07 48.51,56.25 U1.4
PA1: length 8
  Bottom Layer w0.254: U14.6 51.82,51.28 U1.3
PA2: length 7.3
  Top Layer w0.254: U14.7 51.05,49.76 U1.5
PA3: length 10.9
  Top Layer w0.254: U1.6 49.78,55.86 49.78,51.03 U14.8
PA4: length 29.8
  Bottom Layer w0.254: U14.9 44.2,59.03 45.59,60.43 54.1,60.43 56.01,58.52 56.01,55.86 54.74,54.59 U1.7
PA5: length 27.2
  Bottom Layer w0.254: U1.8 52.32,55.86 52.32,53.32 55.5,50.14 55.5,47.09 54.1,45.7 43.94,45.7 U14.10
PB6: length 34.8
  Top Layer w0.254: U14.34 44.07,27.54 36.7,27.54 H4.SCL
PB7: length 36.2
  Top Layer w0.254: H4.SDA 38.86,27.15 48.51,27.15 51.82,30.46 U14.35
PB8: length 8
  Top Layer w0.254: U14.36 54.74,32.36 U15.3
PB9: length 8
  Top Layer w0.254: U15.4 56.9,25.25 U14.37

## Copper pours and planes (outline as drawn; the poured copper is in the pictures)
GND on Top Layer: -14.6,78.72 106.43,78.72 126.87,58.27 126.87,-16.66 130.05,-19.84 -19.05,-19.84 -35.31,-36.09 -35.31,58.02
GND on Bottom Layer: -25.27,126.47 125.22,126.47 125.22,-20.98 -25.27,-20.98
